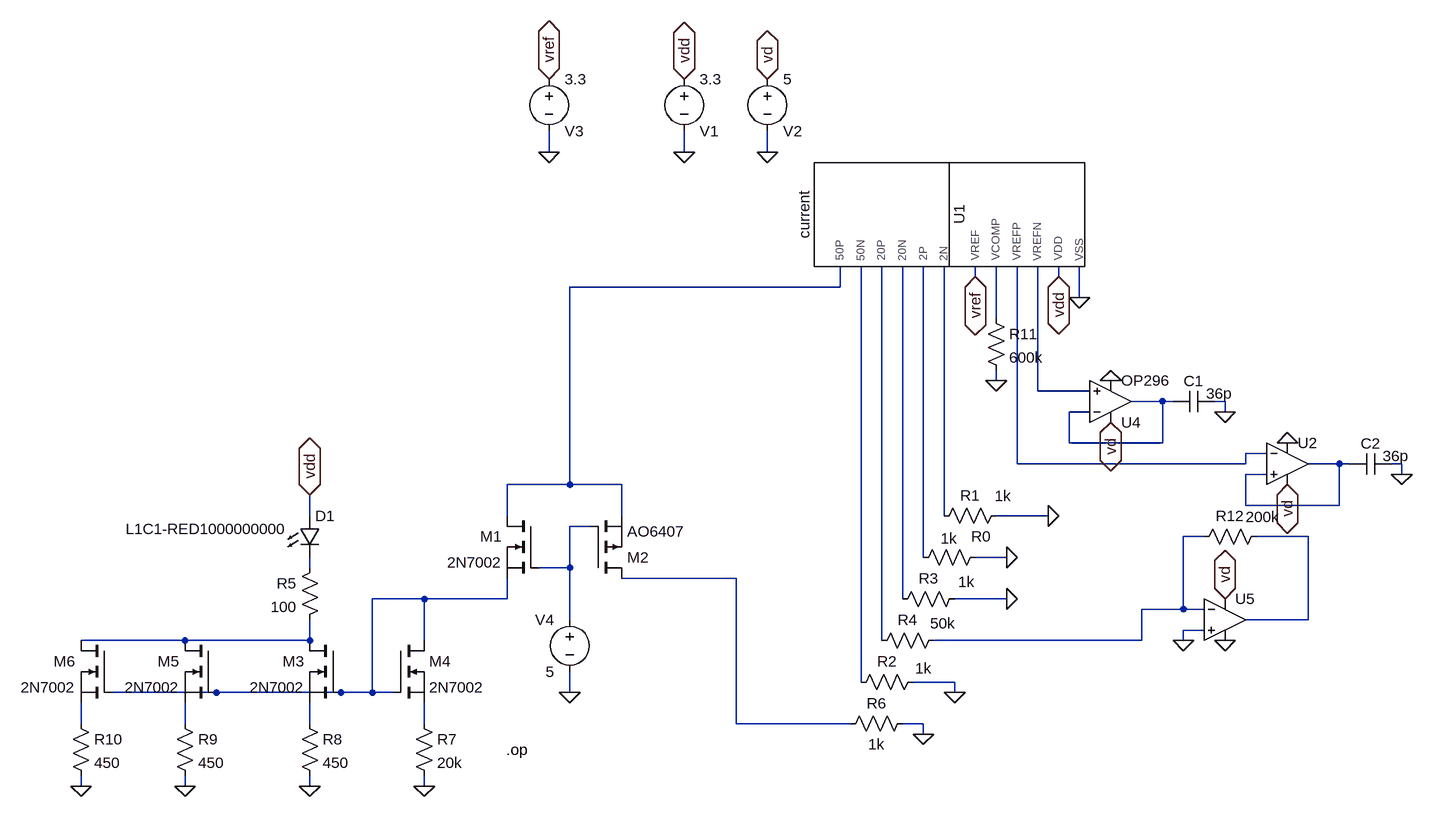
[diagram p0: schematic Chipa_schem.asc]
Chipa_schem.asc, the LTspice schematic file:
Version 4
SHEET 1 1236 1124
WIRE -320 64 -320 32
WIRE -112 64 -112 32
WIRE 16 64 16 32
WIRE 336 256 336 240
WIRE 464 256 464 240
WIRE 128 272 128 240
WIRE 128 272 -288 272
WIRE 496 288 496 240
WIRE 368 320 368 240
WIRE 368 416 368 400
WIRE 432 432 432 240
WIRE 512 432 432 432
WIRE 624 448 576 448
WIRE 640 448 624 448
WIRE 720 448 704 448
WIRE 512 464 480 464
WIRE 720 464 720 448
WIRE 480 512 480 464
WIRE 624 512 624 448
WIRE 624 512 480 512
WIRE 784 528 752 528
WIRE 400 544 400 240
WIRE 752 544 752 528
WIRE 752 544 400 544
WIRE 896 544 848 544
WIRE 912 544 896 544
WIRE 992 544 976 544
WIRE 784 560 752 560
WIRE 992 560 992 544
WIRE -288 576 -288 272
WIRE -288 576 -384 576
WIRE -208 576 -288 576
WIRE 752 608 752 560
WIRE 896 608 896 544
WIRE 896 608 752 608
WIRE -688 624 -688 592
WIRE -384 624 -384 576
WIRE -208 624 -208 576
WIRE 288 624 288 240
WIRE 448 624 368 624
WIRE -256 640 -288 640
WIRE 688 656 656 656
WIRE 848 656 768 656
WIRE 256 688 256 240
WIRE 384 688 336 688
WIRE -688 704 -688 688
WIRE -288 704 -288 640
WIRE -288 704 -336 704
WIRE -32 720 -208 720
WIRE -512 752 -592 752
WIRE -384 752 -384 720
WIRE -384 752 -512 752
WIRE 224 752 224 240
WIRE 384 752 304 752
WIRE 656 768 656 656
WIRE 656 768 592 768
WIRE 688 768 656 768
WIRE -288 784 -288 704
WIRE 848 784 848 656
WIRE 848 784 752 784
WIRE 688 800 656 800
WIRE -880 816 -1040 816
WIRE -688 816 -688 784
WIRE -688 816 -880 816
WIRE -512 816 -512 752
WIRE 192 816 192 240
WIRE 592 816 592 768
WIRE 592 816 272 816
WIRE 656 816 656 800
WIRE 160 880 160 240
WIRE 304 880 240 880
WIRE -832 896 -992 896
WIRE -640 896 -832 896
WIRE -592 896 -592 752
WIRE -592 896 -640 896
WIRE -560 896 -592 896
WIRE -288 896 -288 864
WIRE 304 896 304 880
WIRE -1040 944 -1040 912
WIRE -880 944 -880 912
WIRE -688 944 -688 912
WIRE -512 944 -512 912
WIRE -32 944 -32 720
WIRE 144 944 -32 944
WIRE 256 944 224 944
WIRE 256 960 256 944
WIRE -1040 1040 -1040 1024
WIRE -880 1040 -880 1024
WIRE -688 1040 -688 1024
WIRE -512 1040 -512 1024
FLAG 384 688 0
FLAG 384 752 0
FLAG -112 64 0
FLAG -320 64 0
FLAG -112 -48 vdd
IOPIN -112 -48 BiDir
FLAG -320 -48 vref
IOPIN -320 -48 BiDir
FLAG -288 896 0
FLAG -688 592 vdd
IOPIN -688 592 BiDir
FLAG 496 288 0
FLAG 464 256 vdd
IOPIN 464 256 BiDir
FLAG 336 256 vref
IOPIN 336 256 BiDir
FLAG -512 1040 0
FLAG -688 1040 0
FLAG 544 480 vd
IOPIN 544 480 BiDir
FLAG 720 464 0
FLAG 816 576 vd
IOPIN 816 576 BiDir
FLAG 992 560 0
FLAG -880 1040 0
FLAG -1040 1040 0
FLAG 368 416 0
FLAG 720 752 vd
IOPIN 720 752 BiDir
FLAG 656 816 0
FLAG 304 896 0
FLAG 16 64 0
FLAG 16 -48 vd
IOPIN 16 -48 BiDir
FLAG 448 624 0
FLAG 720 816 0
FLAG 256 960 0
FLAG 544 416 0
FLAG 816 512 0
DATAFLAG -320 576 ""
DATAFLAG -880 736 "I(R5)"
DATAFLAG -480 752 ""
DATAFLAG 48 992 "I(R6)"
DATAFLAG 448 992 "I(R2)"
DATAFLAG 464 864 "I(R4)"
DATAFLAG 464 800 "I(R3)"
DATAFLAG 432 672 "I(R0)"
DATAFLAG 432 608 "I(R1)"
DATAFLAG 624 448 ""
DATAFLAG 896 544 ""
DATAFLAG 464 432 ""
DATAFLAG 464 528 ""
DATAFLAG 576 624 ""
DATAFLAG 608 768 ""
DATAFLAG 848 784 ""
DATAFLAG 288 576 ""
DATAFLAG 256 672 ""
DATAFLAG 224 736 ""
DATAFLAG 192 688 ""
DATAFLAG 160 832 ""
SYMBOL current 176 160 R0
WINDOW 0 120 0 VTop 2
SYMATTR InstName U1
SYMBOL res 384 608 R90
WINDOW 0 0 56 VBottom 2
WINDOW 3 -30 6 VTop 2
SYMATTR InstName R1
SYMATTR Value 1k
SYMBOL res 352 672 R90
WINDOW 0 -1 7 VBottom 2
WINDOW 3 -29 57 VTop 2
SYMATTR InstName R0
SYMATTR Value 1k
SYMBOL res 320 736 R90
WINDOW 0 0 56 VBottom 2
WINDOW 3 -26 -2 VTop 2
SYMATTR InstName R3
SYMATTR Value 1k
SYMBOL res 288 800 R90
WINDOW 0 0 56 VBottom 2
WINDOW 3 -26 2 VTop 2
SYMATTR InstName R4
SYMATTR Value 50k
SYMBOL res 144 896 R270
WINDOW 0 32 56 VTop 2
WINDOW 3 53 112 VBottom 2
SYMATTR InstName R2
SYMATTR Value 1k
SYMBOL voltage -112 -64 R0
WINDOW 0 24 96 Left 2
WINDOW 3 24 16 Left 2
WINDOW 123 0 0 Left 0
WINDOW 39 0 0 Left 0
SYMATTR InstName V1
SYMATTR Value 3.3
SYMBOL voltage -320 -64 R0
WINDOW 0 24 96 Left 2
WINDOW 3 24 16 Left 2
WINDOW 123 0 0 Left 0
WINDOW 39 0 0 Left 0
SYMATTR InstName V3
SYMATTR Value 3.3
SYMBOL nmos -336 624 M0
SYMATTR InstName M1
SYMATTR Value 2N7002
SYMBOL pmos -256 720 M180
SYMATTR InstName M2
SYMATTR Value AO6407
SYMBOL voltage -288 768 M0
WINDOW 123 0 0 Left 0
WINDOW 39 0 0 Left 0
SYMATTR InstName V4
SYMATTR Value 5
SYMBOL nmos -640 816 M0
SYMATTR InstName M3
SYMATTR Value 2N7002
SYMBOL nmos -560 816 R0
SYMATTR InstName M4
SYMATTR Value 2N7002
SYMBOL res -672 688 M0
SYMATTR InstName R5
SYMATTR Value 100
SYMBOL res 240 928 R90
WINDOW 0 0 56 VBottom 2
WINDOW 3 32 56 VTop 2
SYMATTR InstName R6
SYMATTR Value 1k
SYMBOL res -528 928 R0
SYMATTR InstName R7
SYMATTR Value 20k
SYMBOL res -704 928 R0
SYMATTR InstName R8
SYMATTR Value 450
SYMBOL LED -704 624 R0
WINDOW 3 -267 20 Left 2
SYMATTR Value L1C1-RED1000000000
SYMATTR InstName D1
SYMATTR Description Diode
SYMATTR Type diode
SYMBOL cap 704 432 R90
WINDOW 0 0 32 VBottom 2
WINDOW 3 -12 -7 VTop 2
SYMATTR InstName C1
SYMATTR Value 36p
SYMBOL cap 976 528 R90
WINDOW 0 0 32 VBottom 2
WINDOW 3 -12 -7 VTop 2
SYMATTR InstName C2
SYMATTR Value 36p
SYMBOL nmos -832 816 M0
SYMATTR InstName M5
SYMATTR Value 2N7002
SYMBOL res -896 928 R0
SYMATTR InstName R9
SYMATTR Value 450
SYMBOL nmos -992 816 M0
SYMATTR InstName M6
SYMATTR Value 2N7002
SYMBOL res -1056 928 R0
SYMATTR InstName R10
SYMATTR Value 450
SYMBOL OpAmps\\OP296 544 512 M180
SYMATTR InstName U4
SYMBOL res 352 304 R0
SYMATTR InstName R11
SYMATTR Value 600k
SYMBOL res 784 640 R90
WINDOW 0 0 56 VBottom 2
WINDOW 3 -30 6 VTop 2
SYMATTR InstName R12
SYMATTR Value 200k
SYMBOL voltage 16 -64 R0
WINDOW 0 24 96 Left 2
WINDOW 3 24 16 Left 2
WINDOW 123 0 0 Left 0
WINDOW 39 0 0 Left 0
SYMATTR InstName V2
SYMATTR Value 5
SYMBOL OpAmps\\UniversalOpAmp 720 784 R0
SYMATTR InstName U5
SYMBOL OpAmps\\UniversalOpAmp 816 544 R0
SYMATTR InstName U2
TEXT -352 984 Right 2 !.op

The netlist it stands for:
* Chipa_schem.asc
XU1 vref N002 N003 N005 vdd N015 N017 N018 N001 N007 N011 0 current  ; pins VREF VCOMP VREFN VREFP VDD 20N 20P 50N 50P 2N 2P VSS
R1 0 N007 1k
R0 0 N011 1k
R3 0 N015 1k
R4 N009 N017 50k
R2 N018 0 1k
V1 vdd 0 3.3
V3 vref 0 3.3
M1 N001 N008 N014 N014 2N7002
M2 N013 N008 N001 N001 AO6407
V4 N008 0 5
M3 N016 N014 N021 N021 2N7002
M4 N014 N014 N022 N022 2N7002
R5 N012 N016 100
R6 0 N013 1k
R7 N022 0 20k
R8 N021 0 450
D1 vdd N012 L1C1-RED1000000000
C1 0 N004 36p
C2 0 N006 36p
M5 N016 N014 N020 N020 2N7002
R9 N020 0 450
M6 N016 N014 N019 N019 2N7002
R10 N019 0 450
XU4 N003 N004 vd 0 N004 OP296  ; pins In+ In- V+ V- OUT
R11 N002 0 600k
R12 N010 N009 200k
V2 vd 0 5
XU5 0 N009 vd 0 N010 level1 Avol=1Meg GBW=10Meg Vos=0 En=0 Enk=0 In=0 Ink=0 Rin=500Meg  ; pins In+ In- V+ V- OUT
XU2 N006 N005 0 vd N006 level1 Avol=1Meg GBW=10Meg Vos=0 En=0 Enk=0 In=0 Ink=0 Rin=500Meg  ; pins In+ In- V+ V- OUT
.model D D
.lib standard.dio
.model NMOS NMOS
.model PMOS PMOS
.lib standard.mos
.op
.lib C:\Users\escor\OneDrive\Escritorio\Alex onchip\current.txt
.lib UniversalOpAmp1.lib
.backanno
.end